# Altium schematic sheet [02] - BLOCK DIAGRAM.SchDoc
size A3; DocumentNumber: 2; SheetNumber: 2; SheetTotal: 11
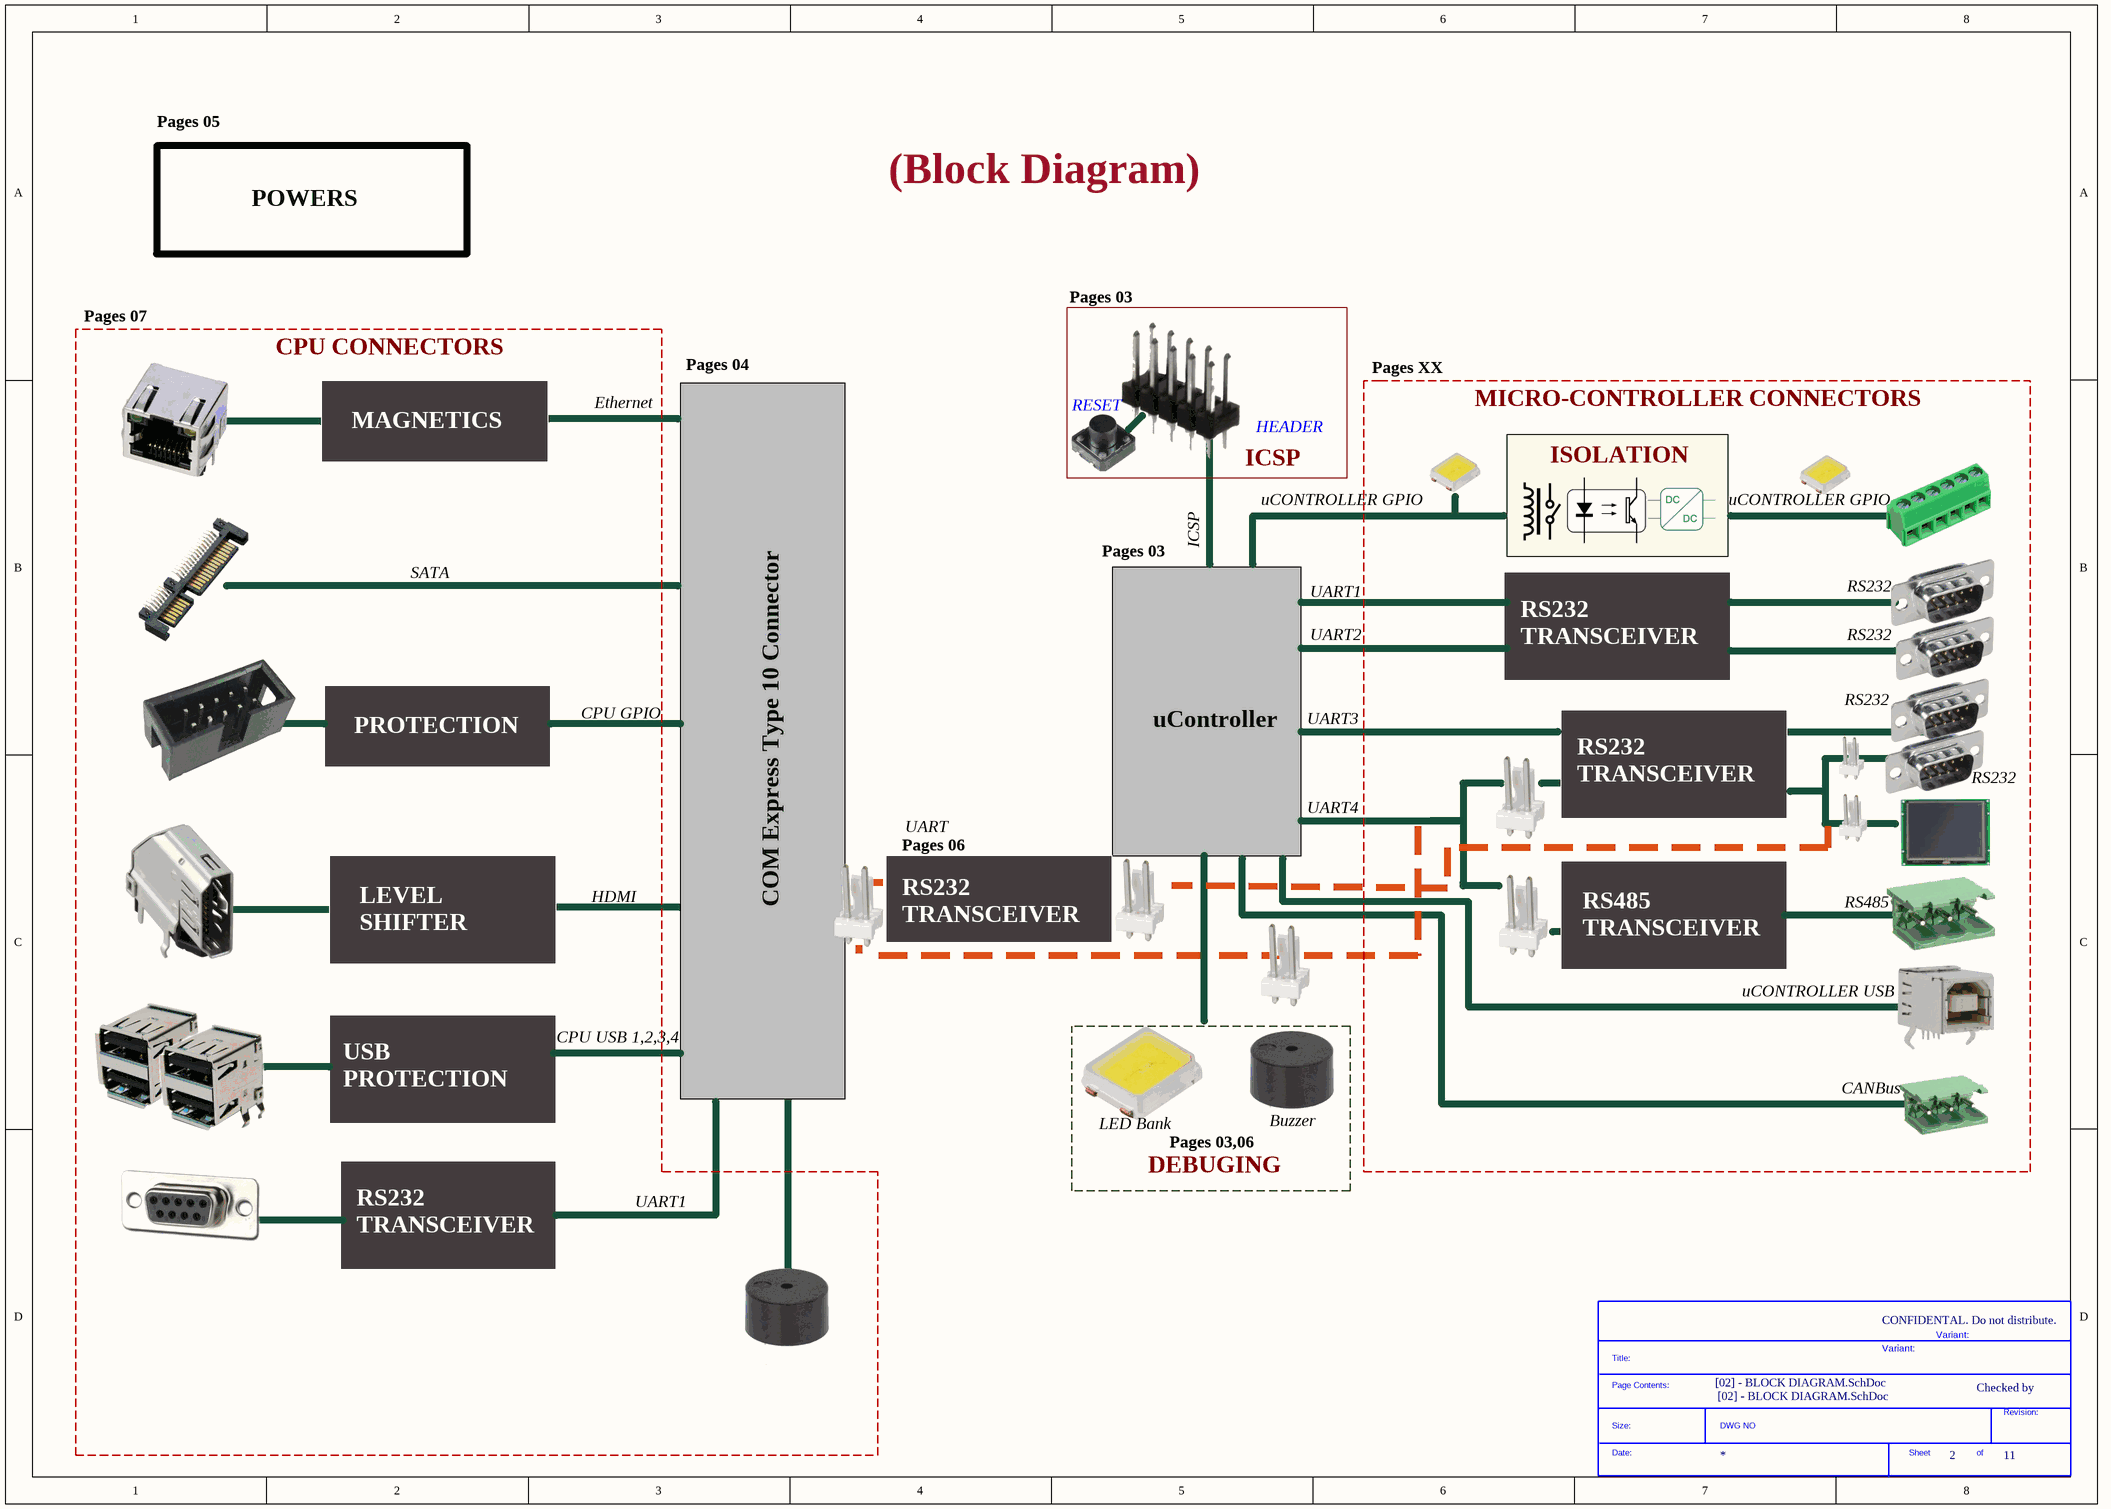
[diagram p0: [02] - BLOCK DIAGRAM.SchDoc]

## Parts
*  SDTitleBlock  (value not drawn)  (graphical)

## Notes on the sheet
- Pages 05
- POWERS
- (Block Diagram)
- Pages 03
- Pages 07
- CPU CONNECTORS
- mSATA
- Pages 04
- Pages XX
- MAGNETICS
- Ethernet
- RESET
- HEADER
- MICRO-CONTROLLER CONNECTORS
- ICSP
- uCONTROLLER GPIO
- ISOLATION
- SATA
- UART1
- UART2
- RS232
  TRANSCEIVER
- RS232
- CPU GPIO
- PROTECTION
- uController
- UART3
- Pages 06
- UART
- UART4
- SWC
- HDMI
- COM Express Type 10 Connector
- RS485
- LEVEL
  SHIFTER
- RS485
  TRANSCEIVER
- CPU USB 1,2,3,4
- uCONTROLLER USB
- USB
  PROTECTION
- Buzzer
- CANBus
- LED Bank
- DEBUGING
- Pages 03,06
- CONFIDENTAL. Do not distribute.
- Variant:
- Checked by